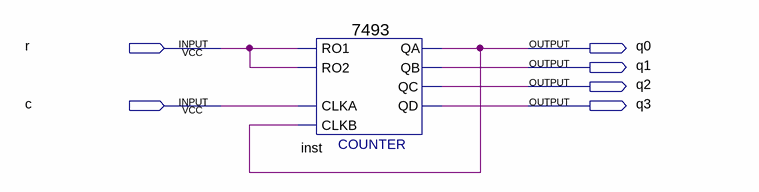
[diagram p0: schematic sheet]
// Quartus schematic Element7493.bdf as structural Verilog: 1 symbols, 6 pins
module Element7493 (
  input  r,
  input  c,
  output q0,
  output q1,
  output q2,
  output q3
);

  \7493  inst (.RO1(r), .RO2(r), .CLKA(c), .CLKB(q0), .QC(q2), .QB(q1), .QA(q0), .QD(q3));
endmodule
